# Altium schematic sheet Sheet6_Power_Path.SchDoc
size A4; SheetNumber: 6; SheetTotal: 6
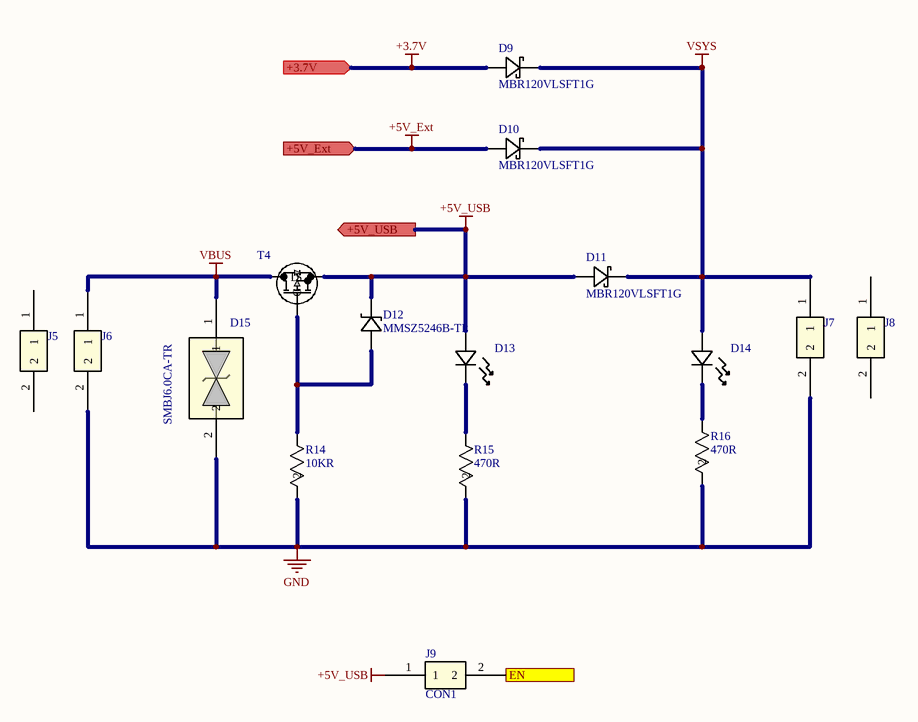
[diagram p0: Sheet6_Power_Path.SchDoc]

## Parts
?  (no value)  (graphical)
D9  MBR120VLSFT1G  [SDO_SOD-123FL_ONS]
D10  MBR120VLSFT1G  [SDO_SOD-123FL_ONS]
D11  MBR120VLSFT1G  [SDO_SOD-123FL_ONS]
D12  MMSZ5246B-TP  [ZDO_SOD123_MCC]
D13  VAOL-S8SB4  [LED_VCCLITE_0805_VCC]  (value not drawn)
D14  VAOL-S8SB4  [LED_VCCLITE_0805_VCC]  (value not drawn)
D15  SMBJ6.0CA-TR  [SMB_BI_STM]
J5  TSW-101-07-G-D  [TSW-101-07-G-D_SAI]  (value not drawn)
J6  TSW-101-07-G-D  [TSW-101-07-G-D_SAI]  (value not drawn)
J7  TSW-101-07-G-D  [TSW-101-07-G-D_SAI]  (value not drawn)
J8  TSW-101-07-G-D  [TSW-101-07-G-D_SAI]  (value not drawn)
J9  CON1  [TSW-101-07-G-D_SAI]
MOSFET3  T4  [SOT-23-3_TO-236_VIS]
R14  10KR  [RES0805_CRG_TYCO_TYC]
R15  470R  [RC0805N_VIS]
R16  470R  [RC0805N_VIS]

## Ports
+3.7V (in, see Sheet2_Hierarquia[2C], Sheet5_Proteção_Bateria[1B]), +5V_Ext (in, see Sheet2_Hierarquia[2C], Sheet3_Buck[4B], Sheet4_Carregador_Bateria[1B]), +5V_USB (out, see Sheet2_Hierarquia[2C], Sheet4_Carregador_Bateria[1B]), EN (out, see Sheet2_Hierarquia[2C], Sheet3_Buck[2B])

## Nets
+3.7V: D9.2 ; port +3.7V
+5V_Ext: D10.2 ; port +5V_Ext
+5V_USB: D11.2 D12.1 D13.2 J9.1 MOSFET3.2(S) ; port +5V_USB
GND: D15.2 J6.2 J7.2 R14.2 R15.2 R16.2
VBUS: D15.1 J6.1 MOSFET3.3(D)
VSYS: D9.1 D10.1 D11.1 D14.2 J7.1
EN: J9.2 ; port EN
NetD12_2: D12.2 MOSFET3.1(G) R14.1
NetD13_1: D13.1 R15.1
NetD14_1: D14.1 R16.1

Not connected (* = marked no-connect by the designer): J5 1 2; J8 1 2

## Notes on the sheet
- Título:
- Endereço:
- Rua Aprígio Veloso, 1500 - Bodocongó
  CEP:58.429-140
  Campina Grande, Paraíba
  Brasil
- Projeto:
- Conta:
- Projetista:
- Arquivo:
- Data:
- Revisor:
- Pág.:
- Rev.:
- de

## Library data of the parts
? = Title Block
D9-D11 = MBR120VLSFT1G: No Description Available; Manufacturer_Name: onsemi; Copyright: Copyright (C) 2026 Ultra Librarian. All rights reserved.; Manufacturer_Part_Number: MBR120VLSFT1G
D12 = MMSZ5246B-TP: DIODE ZENER 16V 500MW SOD123; Manufacturer_Name: MCC; Copyright: Copyright (C) 2026 Ultra Librarian. All rights reserved.; Manufacturer_Part_Number: MMSZ5246B-TP
D13 D14 = VAOL-S8SB4: No Description Available; Manufacturer_Name: VCC; Copyright: Copyright (C) 2026 Ultra Librarian. All rights reserved.; Manufacturer_Part_Number: VAOL-S8SB4
D15 = SMBJ6.0CA-TR: 600 W, 6 V TVS in SMB; Manufacturer_Name: STMicroelectronics; Copyright: Copyright (C) 2026 Ultra Librarian. All rights reserved.; Manufacturer_Part_Number: SMBJ6.0CA-TR; Datasheet: https://www.st.com/resource/en/datasheet/smbj58ca.pdf; RefDes: RefDes; Type: Type
J5-J9 = TSW-101-07-G-D: No Description Available; Manufacturer_Name: Samtec Inc; Copyright: Copyright (C) 2026 Ultra Librarian. All rights reserved.; Manufacturer_Part_Number: TSW-101-07-G-D; RefDes: RefDes; Type: Type
MOSFET3 = SI2319CDS-T1-GE3: P-CHANNEL 40-V (D-S) MOSFET; Manufacturer_Name: Vishay; Copyright: Copyright (C) 2026 Ultra Librarian. All rights reserved.; Manufacturer_Part_Number: SI2319CDS-T1-GE3; Datasheet: https://www.vishay.com/doc?66709
R14 = CRG0805F10K: CRG0805 1% 10K; Manufacturer_Name: TE Connectivity; Copyright: Copyright (C) 2026 Ultra Librarian. All rights reserved.; Manufacturer_Part_Number: CRG0805F10K
R15 R16 = CRCW0805470RJNEA: No Description Available; Manufacturer_Name: Vishay; Copyright: Copyright (C) 2026 Ultra Librarian. All rights reserved.; Manufacturer_Part_Number: CRCW0805470RJNEA; Datasheet: https://www.vishay.com/doc?20035